# Altium schematic sheet Power-Sheet-1.SchDoc (part 1 of 3)
size A4; SheetNumber: 1; SheetTotal: 6
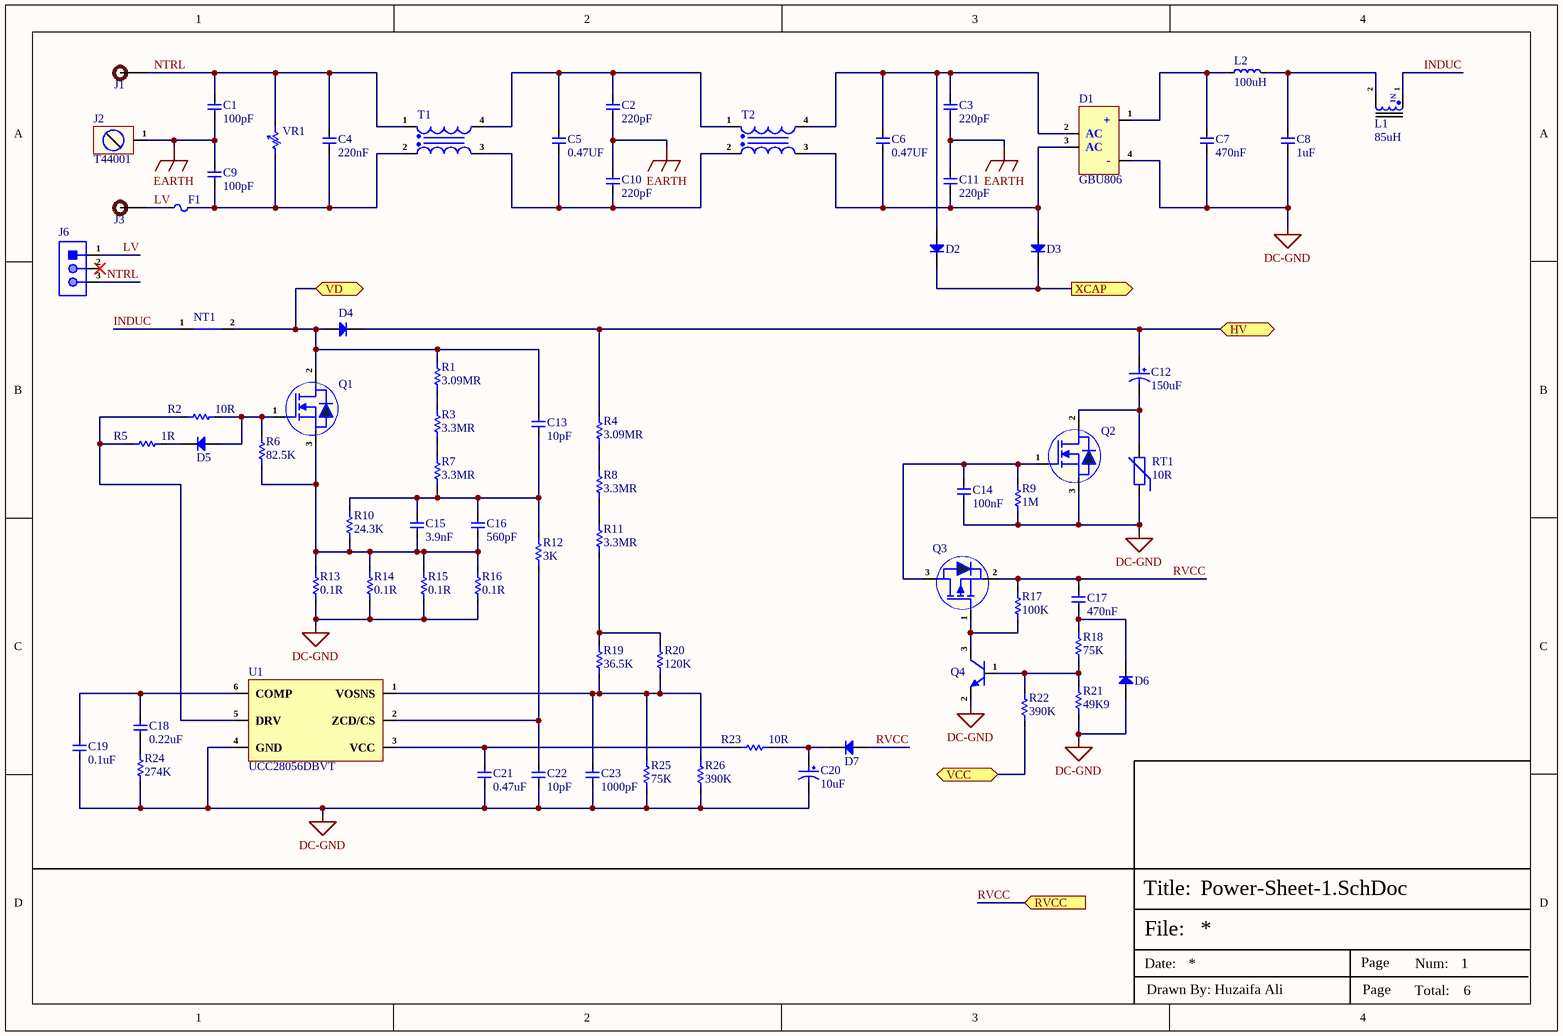
[diagram p0: Power-Sheet-1.SchDoc]

## Parts
C1  100pF  [DE1B3RA101KN4AN01F]
C2  220pF  [DE1B3RA221KN4AN01F]
C3  220pF  [DE1B3RA221KN4AN01F]
C4  220nF  [X2P2224KN1B0130150080ES0]
C5  0.47UF  [R46KI347050M1K]
C6  0.47UF  [R46KI347050M1K]
C7  470nF  [450MPK474J]
C8  1uF  [MPP105J2W10KN22605]
C9  100pF  [DE1B3RA101KN4AN01F]
C10  220pF  [DE1B3RA221KN4AN01F]
C11  220pF  [DE1B3RA221KN4AN01F]
C12  150uF  [KN151M45025*30A]
C13  10pF  [Cap-1206]
C14  100nF  [Cap-0603]
C15  3.9nF  [Cap-0603]
C16  560pF  [Cap-0603]
C17  470nF  [Cap-1206]
C18  0.22uF  [Cap-0603]
C19  0.1uF  [CAP-0603]
C20  10uF  [ERM1HM100D11OT]
C21  0.47uF  [Cap-1206]
C22  10pF  [Cap-0603]
C23  1000pF  [Cap-0603]
D1  GBU806  [GBU]
D2  MURA160T3G  [SMA]  (value not drawn)
D3  MURA160T3G  [SMA]  (value not drawn)
D4  STTH8L06FP  [TO-220-2]  (value not drawn)
D5  MMDL914-TP  [SOD-323]  (value not drawn)
D6  MMDL914-TP  [SOD-323]  (value not drawn)
D7  1N4148WS-7-F  [SOD-323]  (value not drawn)
F1  37215000001  [37215000001]  (value not drawn)
J1  Test Point -TH 1.8mm Hole size 0.92mm  [Test Point -TH 1.8mm Hole size 0.92mm]  (value not drawn)  (no BOM)
J2  T44001  [T44001]
J3  Test Point -TH 1.8mm Hole size 0.92mm  [Test Point -TH 1.8mm Hole size 0.92mm]  (value not drawn)  (no BOM)
J6  X5050WV-03-N2SN  [X5050WV-03-N2SN]  (value not drawn)
L1  85uH  [FC-PFC1060-850M-B-L]
L2  100uH  [7447021]
NT1  Net Tie_SMD  [Net Tie Pad]  (value not drawn)  (net tie, no BOM)
Q1  IPP60R099P7XKSA1  [TO-220-3]  (value not drawn)
Q2  STB24NM60N-VB  [TO-263]  (value not drawn)
Q3  SI2309CDS-T1-E3  [SOT-23]  (value not drawn)
Q4  MMBT4401-7-F  [SOT-23]  (value not drawn)
R1  3.09MR  [Res-1206]
R2  10R  [RES-0805]
R3  3.3MR  [Res-1206]
R4  3.09MR  [Res-1206]
R5  1R  [Res-0603]
R6  82.5K  [Res-0603]
R7  3.3MR  [Res-1206]
R8  3.3MR  [Res-1206]
R9  1M  [Res-0603]
R10  24.3K  [Res-0603]
R11  3.3MR  [Res-1206]
R12  3K  [Res-0603]
R13  0.1R  [Res-1206]
R14  0.1R  [Res-1206]
R15  0.1R  [Res-1206]
R16  0.1R  [Res-1206]
R17  100K  [Res-0603]
R18  75K  [Res-0603]
R19  36.5K  [Res-0603]
R20  120K  [RES-0603]
R21  49K9  [Res-0603]
R22  390K  [Res-0603]
R23  10R  [RES-0805]
R24  274K  [Res-0603]
R25  75K  [Res-0603]
R26  390K  [Res-0603]
RT1  10R  [B57235S0100M000]
T1  744822301  [744822301]  (value not drawn)
T2  744824310  [744824310]  (value not drawn)
U1  UCC28056DBVT  [SOT-23-6]
VR1  B72210S2271K101  [B72210S2271K101]  (value not drawn)

## Ports
HV (bidir, see Power-Sheet-2[1A], Power-Sheet-3[3A]), RVCC (in, see Power-Sheet-3[2B]), VCC (bidir, see Power-Sheet-2[2B], Power-Sheet-3[1A]), VD (bidir), XCAP (out, see Power-Sheet-3[2A])

## Nets
DC-GND: C7.1 C8.1 C14.1 C19.1 C20.2 C21.1 C22.1 C23.1 D1.4(-) D6.2(A) Q2.3(S) Q4.2(E) R9.1 R13.1 R14.1 R15.1 R16.1 R21.1 R24.1 R25.1 R26.1 RT1.1 U1.4(GND)
EARTH: C1.1 C2.1 C3.1 C9.2 C10.2 C11.2 J2.1
HV: C12.1 D4.1(K) R4.2 ; port HV
INDUC: L1.1 NT1.1
LV: F1.1 J3.1 J6.1
NTRL: C1.2 C4.2 J1.1 J6.3 T1.1 VR1.2
RVCC: C17.2 D7.2(A) Q3.2(S) R17.2 ; port RVCC
VCC: R22.1 ; port VCC
VD: C13.2 D4.2(A) NT1.2 Q1.2(D) R1.2 ; port VD
XCAP: D2.1(K) D3.1(K) ; port XCAP
NetC2_2: C2.2 C5.2 T1.4 T2.1
NetC3_2: C3.2 C6.2 D1.2(AC) D2.2(A) T2.4
NetC4_1: C4.1 C9.1 F1.2 T1.2 VR1.1
NetC5_1: C5.1 C10.1 T1.3 T2.2
NetC6_1: C6.1 C11.1 D1.3(AC) D3.2(A) T2.3
NetC7_2: C7.2 D1.1(+) L2.1
NetC8_2: C8.2 L1.2 L2.2
NetC12_2: C12.2 Q2.2(D) RT1.2
NetC13_1: C13.1 C15.2 C16.2 R7.1 R10.2 R12.2
NetC14_2: C14.2 Q2.1(G) Q3.3(D) R9.2
NetC15_1: C15.1 C16.1 Q1.3(S) R6.1 R10.1 R13.2 R14.2 R15.2 R16.2
NetC17_1: C17.1 D6.1(K) R18.2
NetC18_1: C18.1 R24.2
NetC18_2: C18.2 C19.2 U1.6(COMP)
NetC20_1: C20.1 D7.1(K) R23.2
NetC21_2: C21.2 R23.1 U1.3(VCC)
NetC22_2: C22.2 R12.1 U1.2(ZCD/CS)
NetC23_2: C23.2 R19.1 R20.1 R25.2 R26.2 U1.1(VOSNS)
NetD5_1: D5.1(K) R5.2
NetD5_2: D5.2(A) Q1.1(G) R2.2 R6.2
NetQ3_1: Q3.1(G) Q4.3(C) R17.1
NetQ4_1: Q4.1(B) R18.1 R21.2 R22.2
NetR1_1: R1.1 R3.2
NetR2_1: R2.1 R5.1 U1.5(DRV)
NetR3_1: R3.1 R7.2
NetR4_1: R4.1 R8.2
NetR8_1: R8.1 R11.2
NetR11_1: R11.1 R19.2 R20.2

Not connected (* = marked no-connect by the designer): J6 2*

## Notes on the sheet
- File:
- Title:
- Date:
- Page
- Num:
- Total:
- Drawn By: Huzaifa Ali
- (in symbol FC-PFC1060-850M-B-L) N1